# Altium project fuse-27.PrjPcb
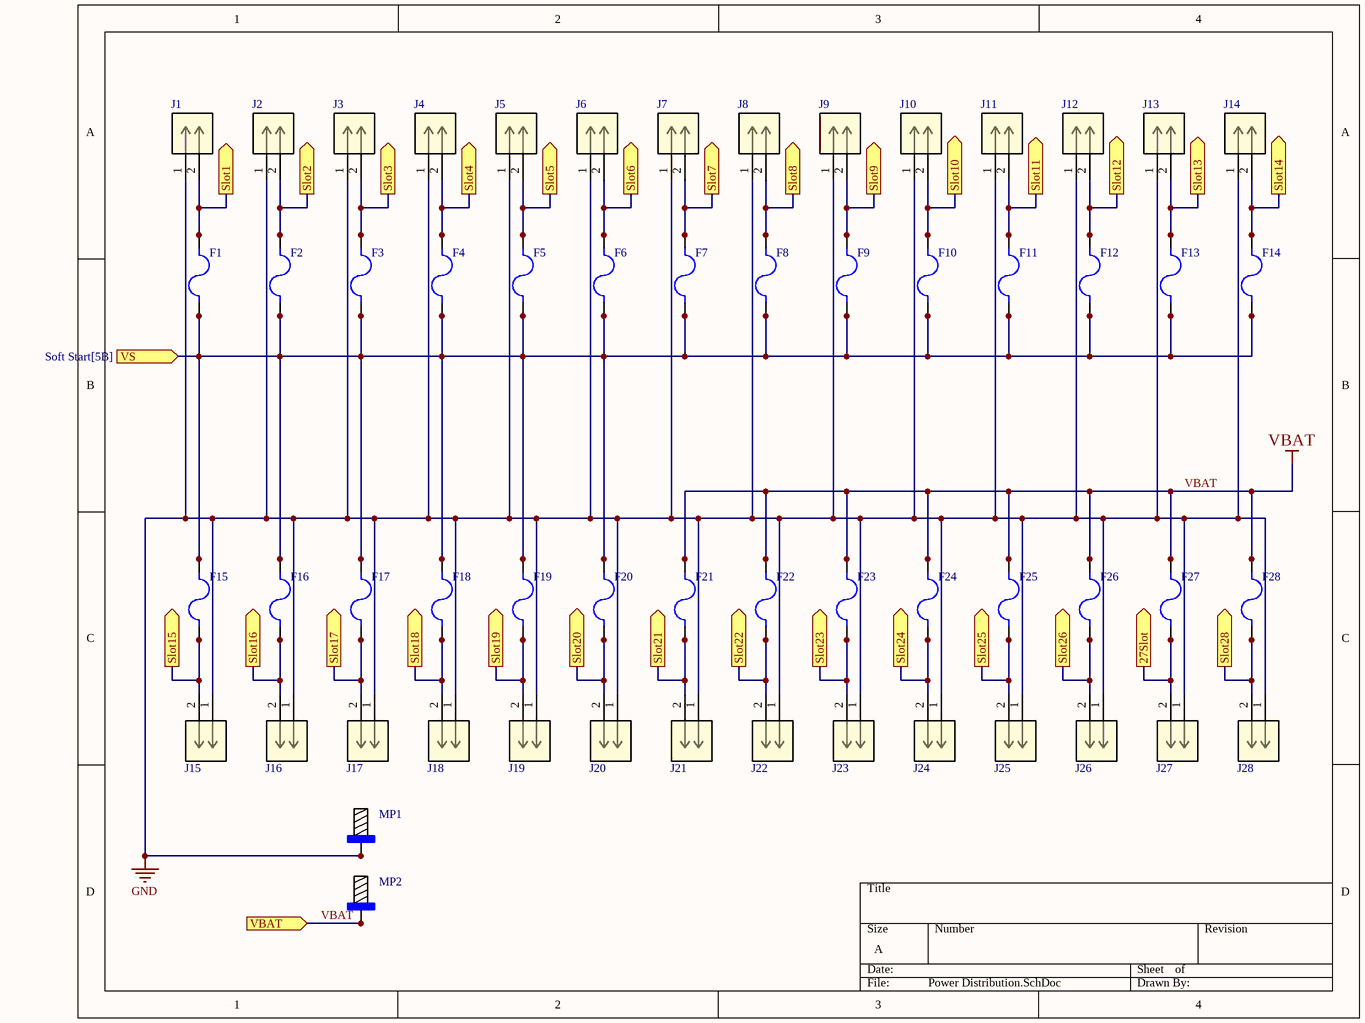
[diagram p0: Power Distribution.SchDoc]
3 sheets, 152 parts. Net scope: global (net labels, ports and power ports of the same name join across sheets).
Board files: Fuse_layout.PcbDoc, testpcb.PcbDoc
Sheets:
  Power Distribution.SchDoc
  Status LEDs.SchDoc
  Soft_Start.SchDoc

## Sheet Power Distribution.SchDoc
size A; SheetNumber: 1; SheetTotal: 3

### Parts
F1  36-3557-2-ND  [CONN_3557-2_KEY]  (value not drawn)
F2  36-3557-2-ND  [CONN_3557-2_KEY]  (value not drawn)
F3  36-3557-2-ND  [CONN_3557-2_KEY]  (value not drawn)
F4  36-3557-2-ND  [CONN_3557-2_KEY]  (value not drawn)
F5  36-3557-2-ND  [CONN_3557-2_KEY]  (value not drawn)
F6  36-3557-2-ND  [CONN_3557-2_KEY]  (value not drawn)
F7  36-3557-2-ND  [CONN_3557-2_KEY]  (value not drawn)
F8  36-3557-2-ND  [CONN_3557-2_KEY]  (value not drawn)
F9  36-3557-2-ND  [CONN_3557-2_KEY]  (value not drawn)
F10  36-3557-2-ND  [CONN_3557-2_KEY]  (value not drawn)
F11  36-3557-2-ND  [CONN_3557-2_KEY]  (value not drawn)
F12  36-3557-2-ND  [CONN_3557-2_KEY]  (value not drawn)
F13  36-3557-2-ND  [CONN_3557-2_KEY]  (value not drawn)
F14  36-3557-2-ND  [CONN_3557-2_KEY]  (value not drawn)
F15  36-3557-2-ND  [CONN_3557-2_KEY]  (value not drawn)
F16  36-3557-2-ND  [CONN_3557-2_KEY]  (value not drawn)
F17  36-3557-2-ND  [CONN_3557-2_KEY]  (value not drawn)
F18  36-3557-2-ND  [CONN_3557-2_KEY]  (value not drawn)
F19  36-3557-2-ND  [CONN_3557-2_KEY]  (value not drawn)
F20  36-3557-2-ND  [CONN_3557-2_KEY]  (value not drawn)
F21  36-3557-2-ND  [CONN_3557-2_KEY]  (value not drawn)
F22  36-3557-2-ND  [CONN_3557-2_KEY]  (value not drawn)
F23  36-3557-2-ND  [CONN_3557-2_KEY]  (value not drawn)
F24  36-3557-2-ND  [CONN_3557-2_KEY]  (value not drawn)
F25  36-3557-2-ND  [CONN_3557-2_KEY]  (value not drawn)
F26  36-3557-2-ND  [CONN_3557-2_KEY]  (value not drawn)
F27  36-3557-2-ND  [CONN_3557-2_KEY]  (value not drawn)
F28  36-3557-2-ND  [CONN_3557-2_KEY]  (value not drawn)
J1  CONN MF+ 2 PIN VERT  [CONN_2068320000-SD_02_MOL]  (value not drawn)
J2  CONN MF+ 2 PIN VERT  [CONN_2068320000-SD_02_MOL]  (value not drawn)
J3  CONN MF+ 2 PIN VERT  [CONN_2068320000-SD_02_MOL]  (value not drawn)
J4  CONN MF+ 2 PIN VERT  [CONN_2068320000-SD_02_MOL]  (value not drawn)
J5  CONN MF+ 2 PIN VERT  [CONN_2068320000-SD_02_MOL]  (value not drawn)
J6  CONN MF+ 2 PIN VERT  [CONN_2068320000-SD_02_MOL]  (value not drawn)
J7  CONN MF+ 2 PIN VERT  [CONN_2068320000-SD_02_MOL]  (value not drawn)
J8  CONN MF+ 2 PIN VERT  [CONN_2068320000-SD_02_MOL]  (value not drawn)
J9  CONN MF+ 2 PIN VERT  [CONN_2068320000-SD_02_MOL]  (value not drawn)
J10  CONN MF+ 2 PIN VERT  [CONN_2068320000-SD_02_MOL]  (value not drawn)
J11  CONN MF+ 2 PIN VERT  [CONN_2068320000-SD_02_MOL]  (value not drawn)
J12  CONN MF+ 2 PIN VERT  [CONN_2068320000-SD_02_MOL]  (value not drawn)
J13  CONN MF+ 2 PIN VERT  [CONN_2068320000-SD_02_MOL]  (value not drawn)
J14  CONN MF+ 2 PIN VERT  [CONN_2068320000-SD_02_MOL]  (value not drawn)
J15  CONN MF+ 2 PIN VERT  [CONN_2068320000-SD_02_MOL]  (value not drawn)
J16  CONN MF+ 2 PIN VERT  [CONN_2068320000-SD_02_MOL]  (value not drawn)
J17  CONN MF+ 2 PIN VERT  [CONN_2068320000-SD_02_MOL]  (value not drawn)
J18  CONN MF+ 2 PIN VERT  [CONN_2068320000-SD_02_MOL]  (value not drawn)
J19  CONN MF+ 2 PIN VERT  [CONN_2068320000-SD_02_MOL]  (value not drawn)
J20  CONN MF+ 2 PIN VERT  [CONN_2068320000-SD_02_MOL]  (value not drawn)
J21  CONN MF+ 2 PIN VERT  [CONN_2068320000-SD_02_MOL]  (value not drawn)
J22  CONN MF+ 2 PIN VERT  [CONN_2068320000-SD_02_MOL]  (value not drawn)
J23  CONN MF+ 2 PIN VERT  [CONN_2068320000-SD_02_MOL]  (value not drawn)
J24  CONN MF+ 2 PIN VERT  [CONN_2068320000-SD_02_MOL]  (value not drawn)
J25  CONN MF+ 2 PIN VERT  [CONN_2068320000-SD_02_MOL]  (value not drawn)
J26  CONN MF+ 2 PIN VERT  [CONN_2068320000-SD_02_MOL]  (value not drawn)
J27  CONN MF+ 2 PIN VERT  [CONN_2068320000-SD_02_MOL]  (value not drawn)
J28  CONN MF+ 2 PIN VERT  [CONN_2068320000-SD_02_MOL]  (value not drawn)
MP1  732-3278-ND  [*WP-SHFU_7461098_HAL]  (value not drawn)
MP2  732-3278-ND  [*WP-SHFU_7461098_HAL]  (value not drawn)

### Ports
27Slot (out, see Status LEDs[4B]), Slot1 (out, see Status LEDs[1A]), Slot2 (out, see Status LEDs[1A]), Slot3 (out, see Status LEDs[1A]), Slot4 (out, see Status LEDs[2A]), Slot5 (out, see Status LEDs[2A]), Slot6 (out, see Status LEDs[2A]), Slot7 (out, see Status LEDs[2A]), Slot8 (out, see Status LEDs[3A]), Slot9 (out, see Status LEDs[3A]), Slot10 (out, see Status LEDs[3A]), Slot11 (out, see Status LEDs[3A]), Slot12 (out, see Status LEDs[4A]), Slot13 (out, see Status LEDs[4A]), Slot14 (out, see Status LEDs[4A]), Slot15 (out, see Status LEDs[1B]), Slot16 (out, see Status LEDs[1B]), Slot17 (out, see Status LEDs[1B]), Slot18 (out, see Status LEDs[2B]), Slot19 (out, see Status LEDs[2B]), Slot20 (out, see Status LEDs[2B]), Slot21 (out, see Status LEDs[2B]), Slot22 (out, see Status LEDs[3B]), Slot23 (out, see Status LEDs[3B]), Slot24 (out, see Status LEDs[3B]), Slot25 (out, see Status LEDs[3B]), Slot26 (out, see Status LEDs[4B]), Slot28 (out, see Status LEDs[4B]), VBAT (in), VS (in, see Soft Start[5B])

### Nets
GND: J1.1 J2.1 J3.1 J4.1 J5.1 J6.1 J7.1 J8.1 J9.1 J10.1 J11.1 J12.1 J13.1 J14.1 J15.1 J16.1 J17.1 J18.1 J19.1 J20.1 J21.1 J22.1 J23.1 J24.1 J25.1 J26.1 J27.1 J28.1 MP1.1 MP1.2 MP1.3 MP1.4 MP1.5 MP1.6 MP1.7 MP1.8 MP1.9 MP1.10 MP1.11 MP1.12 MP1.13 MP1.14 MP1.15 MP1.16 MP1.17 MP1.18 MP1.19 MP1.20 MP1.21 MP1.22 MP1.23 MP1.24 MP1.25
VBAT: F21.1_1 F21.1_2 F22.1_1 F22.1_2 F23.1_1 F23.1_2 F24.1_1 F24.1_2 F25.1_1 F25.1_2 F26.1_1 F26.1_2 F27.1_1 F27.1_2 F28.1_1 F28.1_2 MP2.1 MP2.2 MP2.3 MP2.4 MP2.5 MP2.6 MP2.7 MP2.8 MP2.9 MP2.10 MP2.11 MP2.12 MP2.13 MP2.14 MP2.15 MP2.16 MP2.17 MP2.18 MP2.19 MP2.20 MP2.21 MP2.22 MP2.23 MP2.24 MP2.25 ; port VBAT
VS: F1.2_1 F1.2_2 F2.2_1 F2.2_2 F3.2_1 F3.2_2 F4.2_1 F4.2_2 F5.2_1 F5.2_2 F6.2_1 F6.2_2 F7.2_1 F7.2_2 F8.2_1 F8.2_2 F9.2_1 F9.2_2 F10.2_1 F10.2_2 F11.2_1 F11.2_2 F12.2_1 F12.2_2 F13.2_1 F13.2_2 F14.2_1 F14.2_2 F15.1_1 F15.1_2 F16.1_1 F16.1_2 F17.1_1 F17.1_2 F18.1_1 F18.1_2 F19.1_1 F19.1_2 F20.1_1 F20.1_2 ; port VS
NetF1_1_1: F1.1_1 F1.1_2 J1.2 ; port Slot1
NetF2_1_1: F2.1_1 F2.1_2 J2.2 ; port Slot2
NetF3_1_1: F3.1_1 F3.1_2 J3.2 ; port Slot3
NetF4_1_1: F4.1_1 F4.1_2 J4.2 ; port Slot4
NetF5_1_1: F5.1_1 F5.1_2 J5.2 ; port Slot5
NetF6_1_1: F6.1_1 F6.1_2 J6.2 ; port Slot6
NetF7_1_1: F7.1_1 F7.1_2 J7.2 ; port Slot7
NetF8_1_1: F8.1_1 F8.1_2 J8.2 ; port Slot8
NetF9_1_1: F9.1_1 F9.1_2 J9.2 ; port Slot9
NetF10_1_1: F10.1_1 F10.1_2 J10.2 ; port Slot10
NetF11_1_1: F11.1_1 F11.1_2 J11.2 ; port Slot11
NetF12_1_1: F12.1_1 F12.1_2 J12.2 ; port Slot12
NetF13_1_1: F13.1_1 F13.1_2 J13.2 ; port Slot13
NetF14_1_1: F14.1_1 F14.1_2 J14.2 ; port Slot14
NetF15_2_1: F15.2_1 F15.2_2 J15.2 ; port Slot15
NetF16_2_1: F16.2_1 F16.2_2 J16.2 ; port Slot16
NetF17_2_1: F17.2_1 F17.2_2 J17.2 ; port Slot17
NetF18_2_1: F18.2_1 F18.2_2 J18.2 ; port Slot18
NetF19_2_1: F19.2_1 F19.2_2 J19.2 ; port Slot19
NetF20_2_1: F20.2_1 F20.2_2 J20.2 ; port Slot20
NetF21_2_1: F21.2_1 F21.2_2 J21.2 ; port Slot21
NetF22_2_1: F22.2_1 F22.2_2 J22.2 ; port Slot22
NetF23_2_1: F23.2_1 F23.2_2 J23.2 ; port Slot23
NetF24_2_1: F24.2_1 F24.2_2 J24.2 ; port Slot24
NetF25_2_1: F25.2_1 F25.2_2 J25.2 ; port Slot25
NetF26_2_1: F26.2_1 F26.2_2 J26.2 ; port Slot26
NetF27_2_1: F27.2_1 F27.2_2 J27.2 ; port 27Slot
NetF28_2_1: F28.2_1 F28.2_2 J28.2 ; port Slot28

### Library data of the parts
F1-F28 = FUSE-0002: Fuse Block 30 A 500V 1 Circuit Blade Through Hole / MINI ATO FUSE; MF: Keystone Electronics; MP: 3557-2; Package: Nonstandard Keystone; Check_prices: https://www.snapeda.com/parts/3557-2/Keystone+Electronics/view-part/?ref=eda; Value: *; Purchase-URL: https://pricing.snapeda.com/search/part/3557-2/?ref=eda; Availability: In Stock; SnapEDA_Link: https://www.snapeda.com/parts/3557-2/Keystone+Electronics/view-part/?ref=snap; Price: None
J1-J28 = CONN MF+ 2 PIN VERT: Micro-Fit+ Vertical Header, Through Hole, 3.00mm Pitch, Dual Row, 2 Circuits, Tin (Sn) Plating, Glow-Wire Capable, Black, Tray; Manufacturer_Name: Molex Connector Corporation; Manufacturer_Part_Number: 2068320201; Copyright: Copyright (C) 2025 Ultra Librarian. All rights reserved.; RefDes: RefDes; Type: Type
MP1 MP2 = CONN-1POS-0002: 25 Pin Shank Terminal M6 Through Hole; MF: WÃ¼rth Elektronik; MP: 7461098; Package: None; Price: None; SnapEDA_Link: https://www.snapeda.com/parts/7461098/W%25C3%25BCrth+Elektronik+Midcom/view-part/?ref=snap; Availability: Unavailable; Check_prices: https://www.snapeda.com/parts/7461098/W%25C3%25BCrth+Elektronik+Midcom/view-part/?ref=eda; Value: *

## Sheet Status LEDs.SchDoc
size A; SheetNumber: 2; SheetTotal: 3
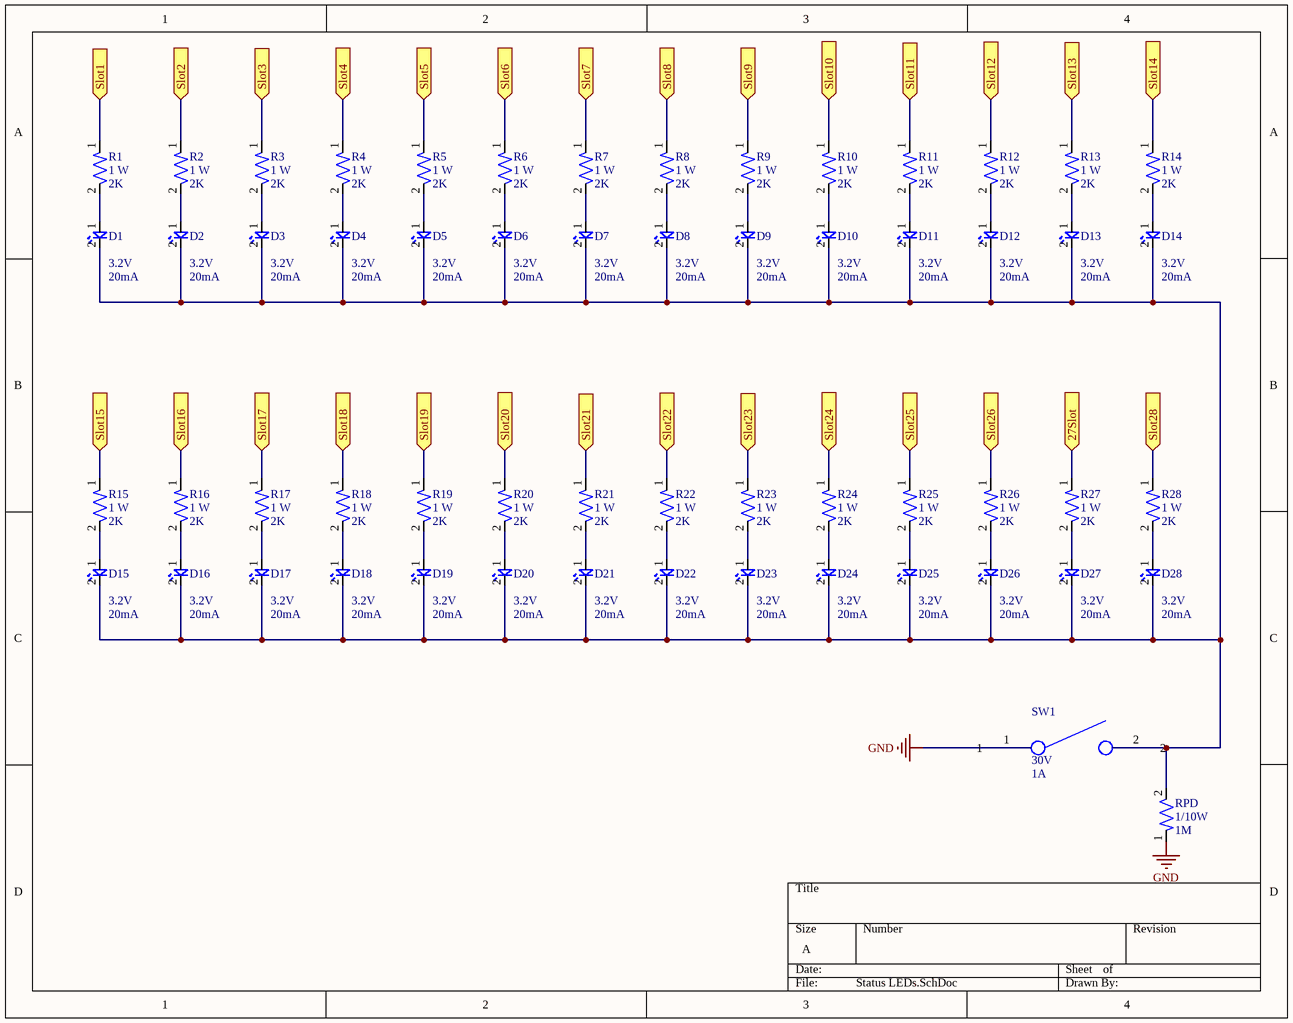
[diagram p1: Status LEDs.SchDoc]

### Parts
D1  Voltage: 3.2V  Current: 20mA  [WL-SMCW_0603]  (hidden comment: 150060GS75000)
D2  Voltage: 3.2V  Current: 20mA  [WL-SMCW_0603]  (hidden comment: 150060GS75000)
D3  Voltage: 3.2V  Current: 20mA  [WL-SMCW_0603]  (hidden comment: 150060GS75000)
D4  Voltage: 3.2V  Current: 20mA  [WL-SMCW_0603]  (hidden comment: 150060GS75000)
D5  Voltage: 3.2V  Current: 20mA  [WL-SMCW_0603]  (hidden comment: 150060GS75000)
D6  Voltage: 3.2V  Current: 20mA  [WL-SMCW_0603]  (hidden comment: 150060GS75000)
D7  Voltage: 3.2V  Current: 20mA  [WL-SMCW_0603]  (hidden comment: 150060GS75000)
D8  Voltage: 3.2V  Current: 20mA  [WL-SMCW_0603]  (hidden comment: 150060GS75000)
D9  Voltage: 3.2V  Current: 20mA  [WL-SMCW_0603]  (hidden comment: 150060GS75000)
D10  Voltage: 3.2V  Current: 20mA  [WL-SMCW_0603]  (hidden comment: 150060GS75000)
D11  Voltage: 3.2V  Current: 20mA  [WL-SMCW_0603]  (hidden comment: 150060GS75000)
D12  Voltage: 3.2V  Current: 20mA  [WL-SMCW_0603]  (hidden comment: 150060GS75000)
D13  Voltage: 3.2V  Current: 20mA  [WL-SMCW_0603]  (hidden comment: 150060GS75000)
D14  Voltage: 3.2V  Current: 20mA  [WL-SMCW_0603]  (hidden comment: 150060GS75000)
D15  Voltage: 3.2V  Current: 20mA  [WL-SMCW_0603]  (hidden comment: 150060GS75000)
D16  Voltage: 3.2V  Current: 20mA  [WL-SMCW_0603]  (hidden comment: 150060GS75000)
D17  Voltage: 3.2V  Current: 20mA  [WL-SMCW_0603]  (hidden comment: 150060GS75000)
D18  Voltage: 3.2V  Current: 20mA  [WL-SMCW_0603]  (hidden comment: 150060GS75000)
D19  Voltage: 3.2V  Current: 20mA  [WL-SMCW_0603]  (hidden comment: 150060GS75000)
D20  Voltage: 3.2V  Current: 20mA  [WL-SMCW_0603]  (hidden comment: 150060GS75000)
D21  Voltage: 3.2V  Current: 20mA  [WL-SMCW_0603]  (hidden comment: 150060GS75000)
D22  Voltage: 3.2V  Current: 20mA  [WL-SMCW_0603]  (hidden comment: 150060GS75000)
D23  Voltage: 3.2V  Current: 20mA  [WL-SMCW_0603]  (hidden comment: 150060GS75000)
D24  Voltage: 3.2V  Current: 20mA  [WL-SMCW_0603]  (hidden comment: 150060GS75000)
D25  Voltage: 3.2V  Current: 20mA  [WL-SMCW_0603]  (hidden comment: 150060GS75000)
D26  Voltage: 3.2V  Current: 20mA  [WL-SMCW_0603]  (hidden comment: 150060GS75000)
D27  Voltage: 3.2V  Current: 20mA  [WL-SMCW_0603]  (hidden comment: 150060GS75000)
D28  Voltage: 3.2V  Current: 20mA  [WL-SMCW_0603]  (hidden comment: 150060GS75000)
R1  Wattage: 1 W  Resistance: 2K  [RES-0805]  (hidden comment: RA73F2A2K0BTD)
R2  Wattage: 1 W  Resistance: 2K  [RES-0805]  (hidden comment: RA73F2A2K0BTD)
R3  Wattage: 1 W  Resistance: 2K  [RES-0805]  (hidden comment: RA73F2A2K0BTD)
R4  Wattage: 1 W  Resistance: 2K  [RES-0805]  (hidden comment: RA73F2A2K0BTD)
R5  Wattage: 1 W  Resistance: 2K  [RES-0805]  (hidden comment: RA73F2A2K0BTD)
R6  Wattage: 1 W  Resistance: 2K  [RES-0805]  (hidden comment: RA73F2A2K0BTD)
R7  Wattage: 1 W  Resistance: 2K  [RES-0805]  (hidden comment: RA73F2A2K0BTD)
R8  Wattage: 1 W  Resistance: 2K  [RES-0805]  (hidden comment: RA73F2A2K0BTD)
R9  Wattage: 1 W  Resistance: 2K  [RES-0805]  (hidden comment: RA73F2A2K0BTD)
R10  Wattage: 1 W  Resistance: 2K  [RES-0805]  (hidden comment: RA73F2A2K0BTD)
R11  Wattage: 1 W  Resistance: 2K  [RES-0805]  (hidden comment: RA73F2A2K0BTD)
R12  Wattage: 1 W  Resistance: 2K  [RES-0805]  (hidden comment: RA73F2A2K0BTD)
R13  Wattage: 1 W  Resistance: 2K  [RES-0805]  (hidden comment: RA73F2A2K0BTD)
R14  Wattage: 1 W  Resistance: 2K  [RES-0805]  (hidden comment: RA73F2A2K0BTD)
R15  Wattage: 1 W  Resistance: 2K  [RES-0805]  (hidden comment: RA73F2A2K0BTD)
R16  Wattage: 1 W  Resistance: 2K  [RES-0805]  (hidden comment: RA73F2A2K0BTD)
R17  Wattage: 1 W  Resistance: 2K  [RES-0805]  (hidden comment: RA73F2A2K0BTD)
R18  Wattage: 1 W  Resistance: 2K  [RES-0805]  (hidden comment: RA73F2A2K0BTD)
R19  Wattage: 1 W  Resistance: 2K  [RES-0805]  (hidden comment: RA73F2A2K0BTD)
R20  Wattage: 1 W  Resistance: 2K  [RES-0805]  (hidden comment: RA73F2A2K0BTD)
R21  Wattage: 1 W  Resistance: 2K  [RES-0805]  (hidden comment: RA73F2A2K0BTD)
R22  Wattage: 1 W  Resistance: 2K  [RES-0805]  (hidden comment: RA73F2A2K0BTD)
R23  Wattage: 1 W  Resistance: 2K  [RES-0805]  (hidden comment: RA73F2A2K0BTD)
R24  Wattage: 1 W  Resistance: 2K  [RES-0805]  (hidden comment: RA73F2A2K0BTD)
R25  Wattage: 1 W  Resistance: 2K  [RES-0805]  (hidden comment: RA73F2A2K0BTD)
R26  Wattage: 1 W  Resistance: 2K  [RES-0805]  (hidden comment: RA73F2A2K0BTD)
R27  Wattage: 1 W  Resistance: 2K  [RES-0805]  (hidden comment: RA73F2A2K0BTD)
R28  Wattage: 1 W  Resistance: 2K  [RES-0805]  (hidden comment: RA73F2A2K0BTD)
RPD  Wattage: 1/10W  Resistance: 1M  [RES-0603]  (hidden comment: RES 0603)
SW1  Voltage: 30V  Current: 1A  [BUTTON-0002]  (hidden comment: GPTS203211B)

### Ports
27Slot (in, see Power Distribution[4C]), Slot1 (in, see Power Distribution[1A]), Slot2 (in, see Power Distribution[1A]), Slot3 (in, see Power Distribution[1A]), Slot4 (in, see Power Distribution[2A]), Slot5 (in, see Power Distribution[2A]), Slot6 (in, see Power Distribution[2A]), Slot7 (in, see Power Distribution[2A]), Slot8 (in, see Power Distribution[3A]), Slot9 (in, see Power Distribution[3A]), Slot10 (in, see Power Distribution[3A]), Slot11 (in, see Power Distribution[3A]), Slot12 (in, see Power Distribution[4A]), Slot13 (in, see Power Distribution[4A]), Slot14 (in, see Power Distribution[4A]), Slot15 (in, see Power Distribution[1C]), Slot16 (in, see Power Distribution[1C]), Slot17 (in, see Power Distribution[1C]), Slot18 (in, see Power Distribution[2C]), Slot19 (in, see Power Distribution[2C]), Slot20 (in, see Power Distribution[2C]), Slot21 (in, see Power Distribution[2C]), Slot22 (in, see Power Distribution[3C]), Slot23 (in, see Power Distribution[3C]), Slot24 (in, see Power Distribution[3C]), Slot25 (in, see Power Distribution[3C]), Slot26 (in, see Power Distribution[4C]), Slot28 (in, see Power Distribution[4C])

### Nets
GND: RPD.1 SW1.1
NetD1_1: D1.1 R1.2
NetD1_2: D1.2 D2.2 D3.2 D4.2 D5.2 D6.2 D7.2 D8.2 D9.2 D10.2 D11.2 D12.2 D13.2 D14.2 D15.2 D16.2 D17.2 D18.2 D19.2 D20.2 D21.2 D22.2 D23.2 D24.2 D25.2 D26.2 D27.2 D28.2 RPD.2 SW1.2
NetD2_1: D2.1 R2.2
NetD3_1: D3.1 R3.2
NetD4_1: D4.1 R4.2
NetD5_1: D5.1 R5.2
NetD6_1: D6.1 R6.2
NetD7_1: D7.1 R7.2
NetD8_1: D8.1 R8.2
NetD9_1: D9.1 R9.2
NetD10_1: D10.1 R10.2
NetD11_1: D11.1 R11.2
NetD12_1: D12.1 R12.2
NetD13_1: D13.1 R13.2
NetD14_1: D14.1 R14.2
NetD15_1: D15.1 R15.2
NetD16_1: D16.1 R16.2
NetD17_1: D17.1 R17.2
NetD18_1: D18.1 R18.2
NetD19_1: D19.1 R19.2
NetD20_1: D20.1 R20.2
NetD21_1: D21.1 R21.2
NetD22_1: D22.1 R22.2
NetD23_1: D23.1 R23.2
NetD24_1: D24.1 R24.2
NetD25_1: D25.1 R25.2
NetD26_1: D26.1 R26.2
NetD27_1: D27.1 R27.2
NetD28_1: D28.1 R28.2
NetF1_1_1: R1.1 ; port Slot1
NetF2_1_1: R2.1 ; port Slot2
NetF3_1_1: R3.1 ; port Slot3
NetF4_1_1: R4.1 ; port Slot4
NetF5_1_1: R5.1 ; port Slot5
NetF6_1_1: R6.1 ; port Slot6
NetF7_1_1: R7.1 ; port Slot7
NetF8_1_1: R8.1 ; port Slot8
NetF9_1_1: R9.1 ; port Slot9
NetF10_1_1: R10.1 ; port Slot10
NetF11_1_1: R11.1 ; port Slot11
NetF12_1_1: R12.1 ; port Slot12
NetF13_1_1: R13.1 ; port Slot13
NetF14_1_1: R14.1 ; port Slot14
NetF15_2_1: R15.1 ; port Slot15
NetF16_2_1: R16.1 ; port Slot16
NetF17_2_1: R17.1 ; port Slot17
NetF18_2_1: R18.1 ; port Slot18
NetF19_2_1: R19.1 ; port Slot19
NetF20_2_1: R20.1 ; port Slot20
NetF21_2_1: R21.1 ; port Slot21
NetF22_2_1: R22.1 ; port Slot22
NetF23_2_1: R23.1 ; port Slot23
NetF24_2_1: R24.1 ; port Slot24
NetF25_2_1: R25.1 ; port Slot25
NetF26_2_1: R26.1 ; port Slot26
NetF27_2_1: R27.1 ; port 27Slot
NetF28_2_1: R28.1 ; port Slot28

### Library data of the parts
D1-D28 = LED-0002: Green 520nm LED Indication - Discrete 3.2V 0603 (1608 Metric)
R1-R28 = RES-2K-0001: 2 kOhms ±0.1% 1W Chip Resistor 0805 (2012 Metric) Thin Film
SW1 = BUTTON-0002: Pushbutton Switch SPST Standard Through Hole

## Sheet Soft_Start.SchDoc
size B; SheetNumber: 3; SheetTotal: 3
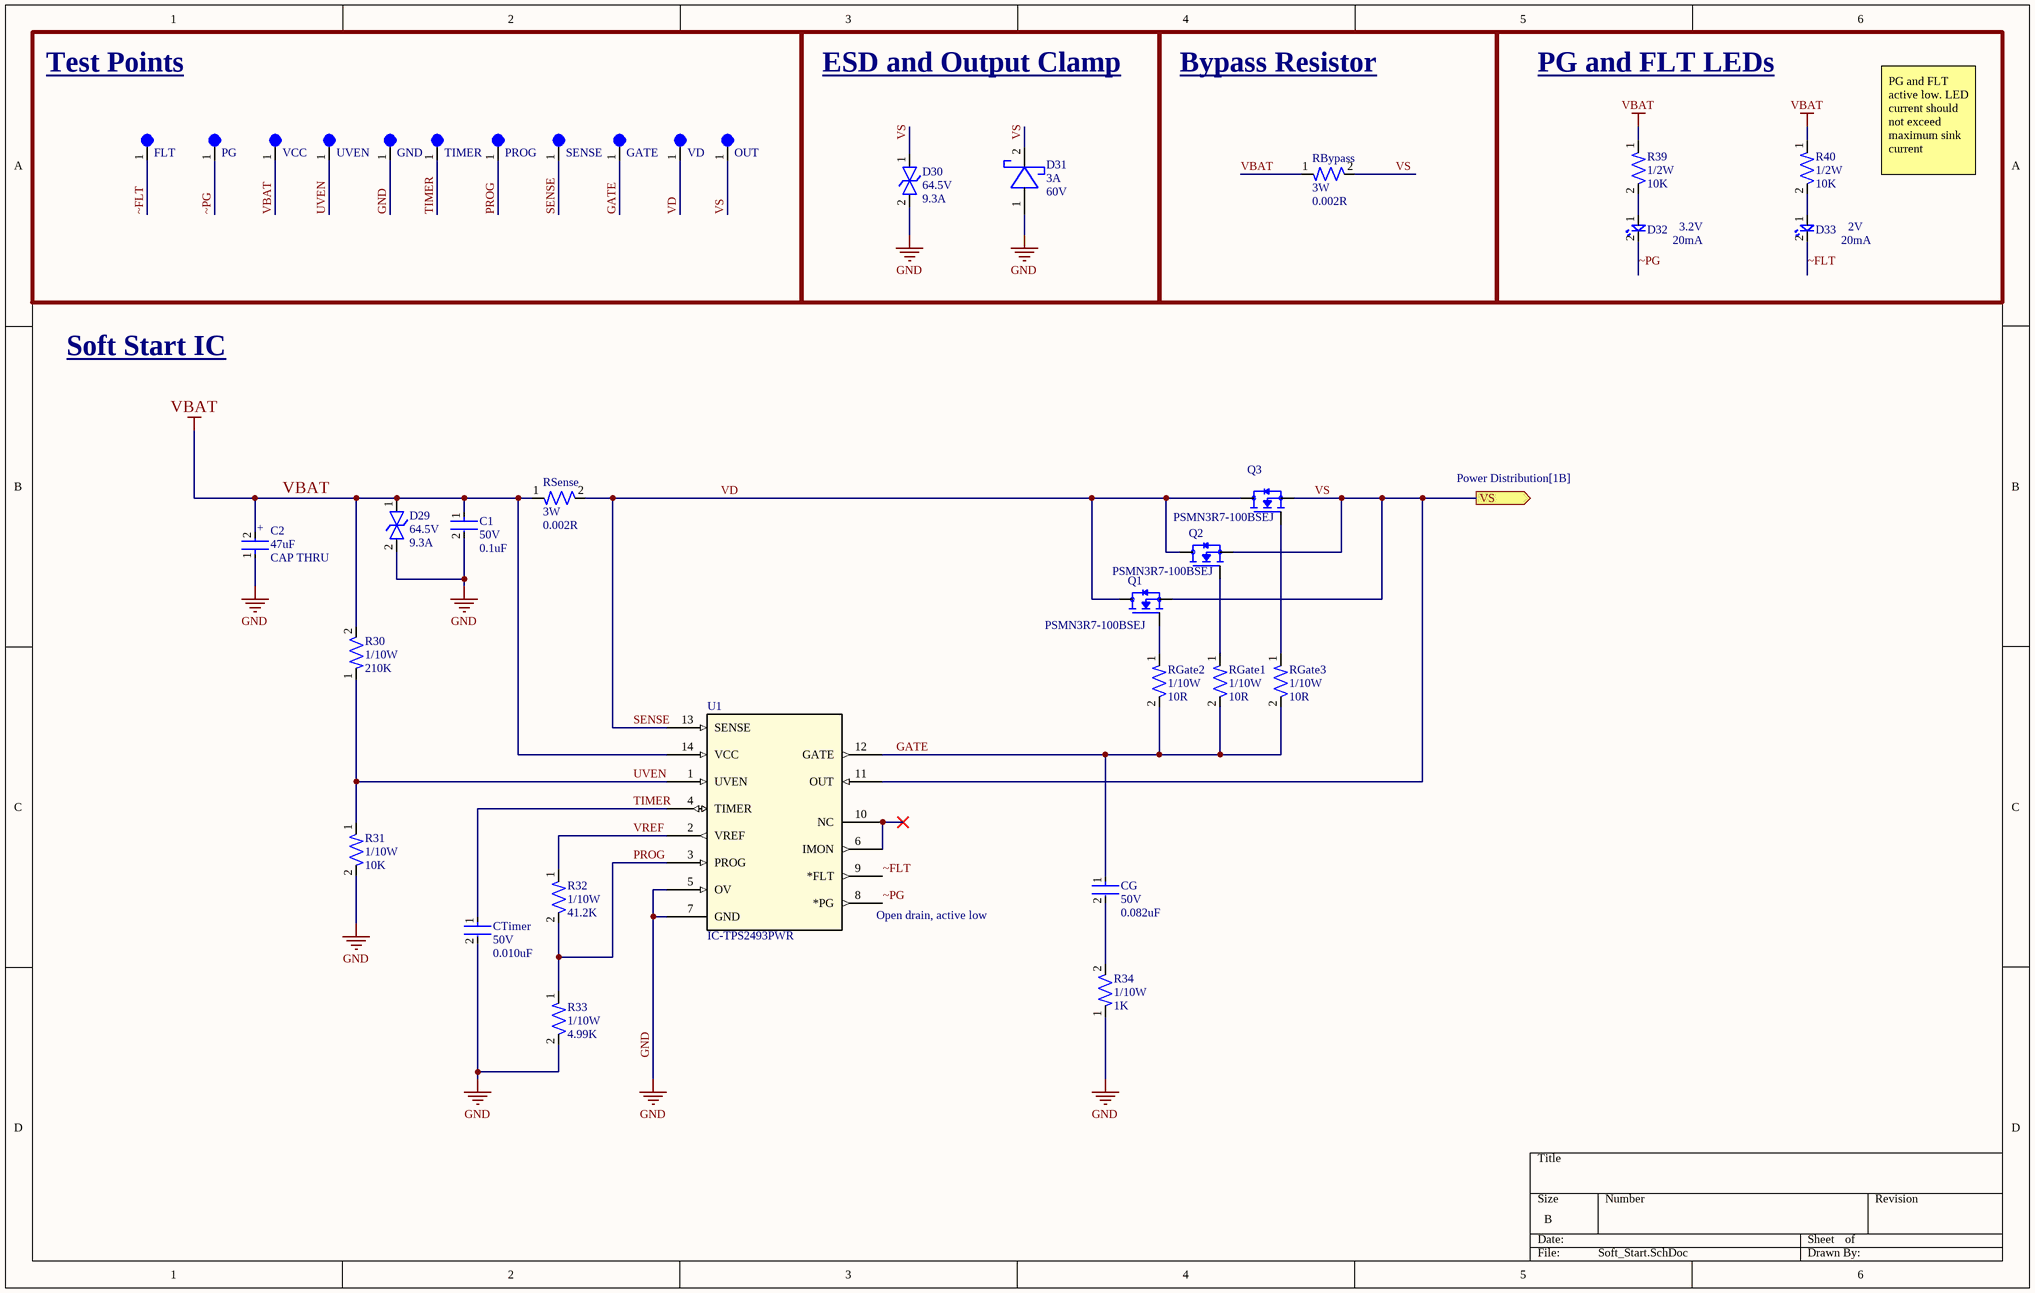
[diagram p2: Soft_Start.SchDoc]

### Parts
C1  Voltage Rating: 50V  Capacitance: 0.1uF  [CAP-0603]  (hidden comment: GRM1885C1H103JA01D)
C2  CAP THRU  value 47uF  [WCAP-ATUL_8X11.5(DXL)]
CG  Voltage Rating: 50V  Capacitance: 0.082uF  [CAP-1206]  (hidden comment: CAP 1206)
CTimer  Voltage Rating: 50V  Capacitance: 0.010uF  [CAP-0603]  (hidden comment: CAP 0603)
D29  Voltage Rating: 64.5V  Current Rating: 9.3A  [DO-214AA (SMBJ)]  (hidden comment: SMBJ40CA)
D30  Voltage Rating: 64.5V  Current Rating: 9.3A  [DO-214AA (SMBJ)]  (hidden comment: SMBJ40CA)
D31  Current Rating: 3A  Reverse Voltage: 60V  [DIO-SOD128]  (hidden comment: PMEG6030EP,115)
D32  Voltage: 3.2V  Current: 20mA  [WL-SMCW_0603]  (hidden comment: 150060GS75000)
D33  Voltage: 2V  Current: 20mA  [WL-SMCW_0603]  (hidden comment: LTST-C191KRKT)
FLT  5003  [TEST-POINT-0001]  (value not drawn)
GATE  5003  [TEST-POINT-0001]  (value not drawn)
GND  5003  [TEST-POINT-0001]  (value not drawn)
OUT  5003  [TEST-POINT-0001]  (value not drawn)
PG  5003  [TEST-POINT-0001]  (value not drawn)
PROG  5003  [TEST-POINT-0001]  (value not drawn)
Q1  PSMN3R7-100BSEJ  [TRANS_PSMN3R7-100BSEJ]
Q2  PSMN3R7-100BSEJ  [TRANS_PSMN3R7-100BSEJ]
Q3  PSMN3R7-100BSEJ  [TRANS_PSMN3R7-100BSEJ]
R30  Wattage: 1/10W  Resistance: 210K  [RES-0603]  (hidden comment: RES 0603)
R31  Wattage: 1/10W  Resistance: 10K  [RES-0603]  (hidden comment: RT0603DRD0710KL)
R32  Wattage: 1/10W  Resistance: 41.2K  [RES-0603]  (hidden comment: ERJ-3EKF4122V)
R33  Wattage: 1/10W  Resistance: 4.99K  [RES-0603]  (hidden comment: ERJ-3EKF2001V)
R34  Wattage: 1/10W  Resistance: 1K  [RES-0603]  (hidden comment: RES 0603)
R39  Wattage: 1/2W  Resistance: 10K  [RES-0805]  (hidden comment: ERJ-P06F1002V)
R40  Wattage: 1/2W  Resistance: 10K  [RES-0805]  (hidden comment: ERJ-P06F1002V)
RBypass  Wattage: 3W  Resistance: 0.002R  [RES-2512]  (hidden comment: RES 2512)
RGate1  Wattage: 1/10W  Resistance: 10R  [RES-0603]  (hidden comment: CRCW060310R0FKEA)
RGate2  Wattage: 1/10W  Resistance: 10R  [RES-0603]  (hidden comment: CRCW060310R0FKEA)
RGate3  Wattage: 1/10W  Resistance: 10R  [RES-0603]  (hidden comment: CRCW060310R0FKEA)
RSense  Wattage: 3W  Resistance: 0.002R  [RES-2512]  (hidden comment: VMS-R010-1.0-U)
SENSE  5003  [TEST-POINT-0001]  (value not drawn)
TIMER  5003  [TEST-POINT-0001]  (value not drawn)
U1  IC-TPS2493PWR  [PW14]
UVEN  5003  [TEST-POINT-0001]  (value not drawn)
VCC  5003  [TEST-POINT-0001]  (value not drawn)
VD  5003  [TEST-POINT-0001]  (value not drawn)

### Blocks framed on the sheet
Test Points: FLT GATE GND OUT PG PROG SENSE TIMER UVEN VCC VD
ESD and Output Clamp: D30 D31
Bypass Resistor: RBypass
PG and FLT LEDs: D32 D33 R39 R40

### Ports
VS (out, see Power Distribution[1B])

### Nets
GND: C1.2 C2.1 CTimer.2 D29.2 D30.2 D31.1(CATHODE) GND.1 R31.2 R33.2 R34.1 U1.5(OV) U1.7(GND)
VBAT: C1.1 C2.2 D29.1 R30.2 R39.1 R40.1 RBypass.1 RSense.1 U1.14(VCC) VCC.1
GATE: CG.1 GATE.1 RGate1.2 RGate2.2 RGate3.2 U1.12(GATE)
PROG: PROG.1 R32.2 R33.1 U1.3(PROG)
SENSE: Q1.MB(D) Q2.MB(D) Q3.MB(D) RSense.2 SENSE.1 U1.13(SENSE) VD.1  [also labelled VD]
TIMER: CTimer.1 TIMER.1 U1.4(TIMER)
UVEN: R30.1 R31.1 U1.1(UVEN) UVEN.1
VREF: R32.1 U1.2(VREF)
VS: D30.1 D31.2(ANODE) OUT.1 Q1.3(S) Q2.3(S) Q3.3(S) RBypass.2 U1.11(OUT) ; port VS
~FLT: D33.2 FLT.1 U1.9(*FLT)
~PG: D32.2 PG.1 U1.8(*PG)
NetCG_2: CG.2 R34.2
NetD32_1: D32.1 R39.2
NetD33_1: D33.1 R40.2
NetQ1_1: Q1.1(G) RGate2.1
NetQ2_1: Q2.1(G) RGate1.1
NetQ3_1: Q3.1(G) RGate3.1
NetU1_6: U1.6(IMON) U1.10(NC)

### Notes on the sheet
- PG and FLT active low. LED current should not exceed maximum sink current
- Soft Start IC
- (near U1) Open drain, active low
- (in symbol CAP THRU) +

### Library data of the parts
C1 CTimer = CAP 0603: 10000 pF ±5% 50V Ceramic Capacitor C0G, NP0 0603 (1608 Metric)
C2 = CAP THRU: 47 µF 100 V Aluminum Electrolytic Capacitors Radial, Can 7000 Hrs @ 105°C; MF: {'manufacturer': u'W\xfcrth Elektronik'}; MP: 860040674004; Package: None; Price: None; Availability: Unavailable
CG = CAP 1206: 0.082 µF ±5% 50V Ceramic Capacitor C0G, NP0 1206 (3216 Metric)
D29 D30 = DIO-TVS-0001: TVS DIODE 40VWM 64.5VC DO214AA; ComponentLink1Description: Datasheet; ComponentLink1URL: https://www.littelfuse.com/media?resourcetype=datasheets&itemid=09a6ae9a-73cb-4ac4-acac-e6dab92ab953&filename=littelfuse_tvs_diode_smbj_datasheet.pdf
D31 = DIO-SCHOTTKY-0003: DIODE SCHOTTKY 60V 3A SOD128; ComponentLink1Description: Datasheet; ComponentLink1URL: https://assets.nexperia.com/documents/data-sheet/PMEG6030EP.pdf
D32 = LED-0002: as D1 on sheet Status LEDs
D33 = LED-0002: Red 631nm LED Indication - Discrete 2V 0603 (1608 Metric)
FLT GATE GND OUT PG PROG SENSE TIMER UVEN VCC VD = TEST-POINT-0001: Oranange PC Test Point, Miniature Phoisphor Bronze Silver Plating Through Hole Mounting Type
Q1-Q3 = PSMN3R7-100BSEJ: N-Channel 100 V 120A (Ta) 405W (Ta) Surface Mount D2PAK; MF: Nexperia USA Inc.; SnapEDA_Link: https://www.snapeda.com/parts/PSMN3R7-100BSEJ/Nexperia/view-part/?ref=snap; Package: D2PAK-3 Nexperia USA Inc.; Value: *; MP: PSMN3R7-100BSEJ; Check_prices: https://www.snapeda.com/parts/PSMN3R7-100BSEJ/Nexperia/view-part/?ref=eda
R31 = RES 0603: 10 kOhms ±0.5% 0.1W, 1/10W Chip Resistor 0603 (1608 Metric) Thin Film
R32 = RES 0603: 41.2 kOhms ±1% 0.1W, 1/10W Chip Resistor 0603 (1608 Metric) Automotive AEC-Q200 Thick Film
R33 = RES 0603: 4.99 kOhms ±0.1% 0.1W, 1/10W Chip Resistor 0603 (1608 Metric) Anti-Sulfur, Automotive AEC-Q200 Thin Film
R34 = RES 0603: 1 kOhms ±0.1% 0.1W, 1/10W Chip Resistor 0603 (1608 Metric) Anti-Sulfur, Automotive AEC-Q200 Thin Film
R39 R40 = RES 0805: RES SMD 10K OHM 1% 1/2W 0805
RBypass RSense = RES 2512: 2 mOhms ±1% 3W Chip Resistor 2512 (6332 Metric) Automotive AEC-Q200, Current Sense, Moisture Resistant Metal Element
RGate1-RGate3 = RES 0603: 10 Ohms ±1% 0.1W, 1/10W Chip Resistor 0603 (1608 Metric) Automotive AEC-Q200 Thick Film
U1 = IC-TPS2493PWR: 9-V to 80-V hot swap controller with power limiting, Auto Retry and analog current monitor 14-TSSOP -40 to 125; Manufacturer_Name: Texas Instruments; Copyright: Copyright (C) 2026 Ultra Librarian. All rights reserved.; Manufacturer_Part_Number: TPS2493PWR; RefDes: RefDes; Type: Type

## Nets that join several sheets
GND: Power Distribution (53 pins), Status LEDs (RPD.1 SW1.1), Soft_Start (12 pins)
VBAT: Power Distribution (41 pins), Soft_Start (10 pins)
NetF1_1_1: Power Distribution (F1.1_1 F1.1_2 J1.2), Status LEDs (R1.1)
NetF2_1_1: Power Distribution (F2.1_1 F2.1_2 J2.2), Status LEDs (R2.1)
NetF3_1_1: Power Distribution (F3.1_1 F3.1_2 J3.2), Status LEDs (R3.1)
NetF4_1_1: Power Distribution (F4.1_1 F4.1_2 J4.2), Status LEDs (R4.1)
NetF5_1_1: Power Distribution (F5.1_1 F5.1_2 J5.2), Status LEDs (R5.1)
NetF6_1_1: Power Distribution (F6.1_1 F6.1_2 J6.2), Status LEDs (R6.1)
NetF7_1_1: Power Distribution (F7.1_1 F7.1_2 J7.2), Status LEDs (R7.1)
NetF8_1_1: Power Distribution (F8.1_1 F8.1_2 J8.2), Status LEDs (R8.1)
NetF9_1_1: Power Distribution (F9.1_1 F9.1_2 J9.2), Status LEDs (R9.1)
NetF10_1_1: Power Distribution (F10.1_1 F10.1_2 J10.2), Status LEDs (R10.1)
NetF11_1_1: Power Distribution (F11.1_1 F11.1_2 J11.2), Status LEDs (R11.1)
NetF12_1_1: Power Distribution (F12.1_1 F12.1_2 J12.2), Status LEDs (R12.1)
NetF13_1_1: Power Distribution (F13.1_1 F13.1_2 J13.2), Status LEDs (R13.1)
NetF14_1_1: Power Distribution (F14.1_1 F14.1_2 J14.2), Status LEDs (R14.1)
NetF15_2_1: Power Distribution (F15.2_1 F15.2_2 J15.2), Status LEDs (R15.1)
NetF16_2_1: Power Distribution (F16.2_1 F16.2_2 J16.2), Status LEDs (R16.1)
NetF17_2_1: Power Distribution (F17.2_1 F17.2_2 J17.2), Status LEDs (R17.1)
NetF18_2_1: Power Distribution (F18.2_1 F18.2_2 J18.2), Status LEDs (R18.1)
NetF19_2_1: Power Distribution (F19.2_1 F19.2_2 J19.2), Status LEDs (R19.1)
NetF20_2_1: Power Distribution (F20.2_1 F20.2_2 J20.2), Status LEDs (R20.1)
NetF21_2_1: Power Distribution (F21.2_1 F21.2_2 J21.2), Status LEDs (R21.1)
NetF22_2_1: Power Distribution (F22.2_1 F22.2_2 J22.2), Status LEDs (R22.1)
NetF23_2_1: Power Distribution (F23.2_1 F23.2_2 J23.2), Status LEDs (R23.1)
NetF24_2_1: Power Distribution (F24.2_1 F24.2_2 J24.2), Status LEDs (R24.1)
NetF25_2_1: Power Distribution (F25.2_1 F25.2_2 J25.2), Status LEDs (R25.1)
NetF26_2_1: Power Distribution (F26.2_1 F26.2_2 J26.2), Status LEDs (R26.1)
NetF27_2_1: Power Distribution (F27.2_1 F27.2_2 J27.2), Status LEDs (R27.1)
NetF28_2_1: Power Distribution (F28.2_1 F28.2_2 J28.2), Status LEDs (R28.1)
VS: Power Distribution (40 pins), Soft_Start (8 pins)